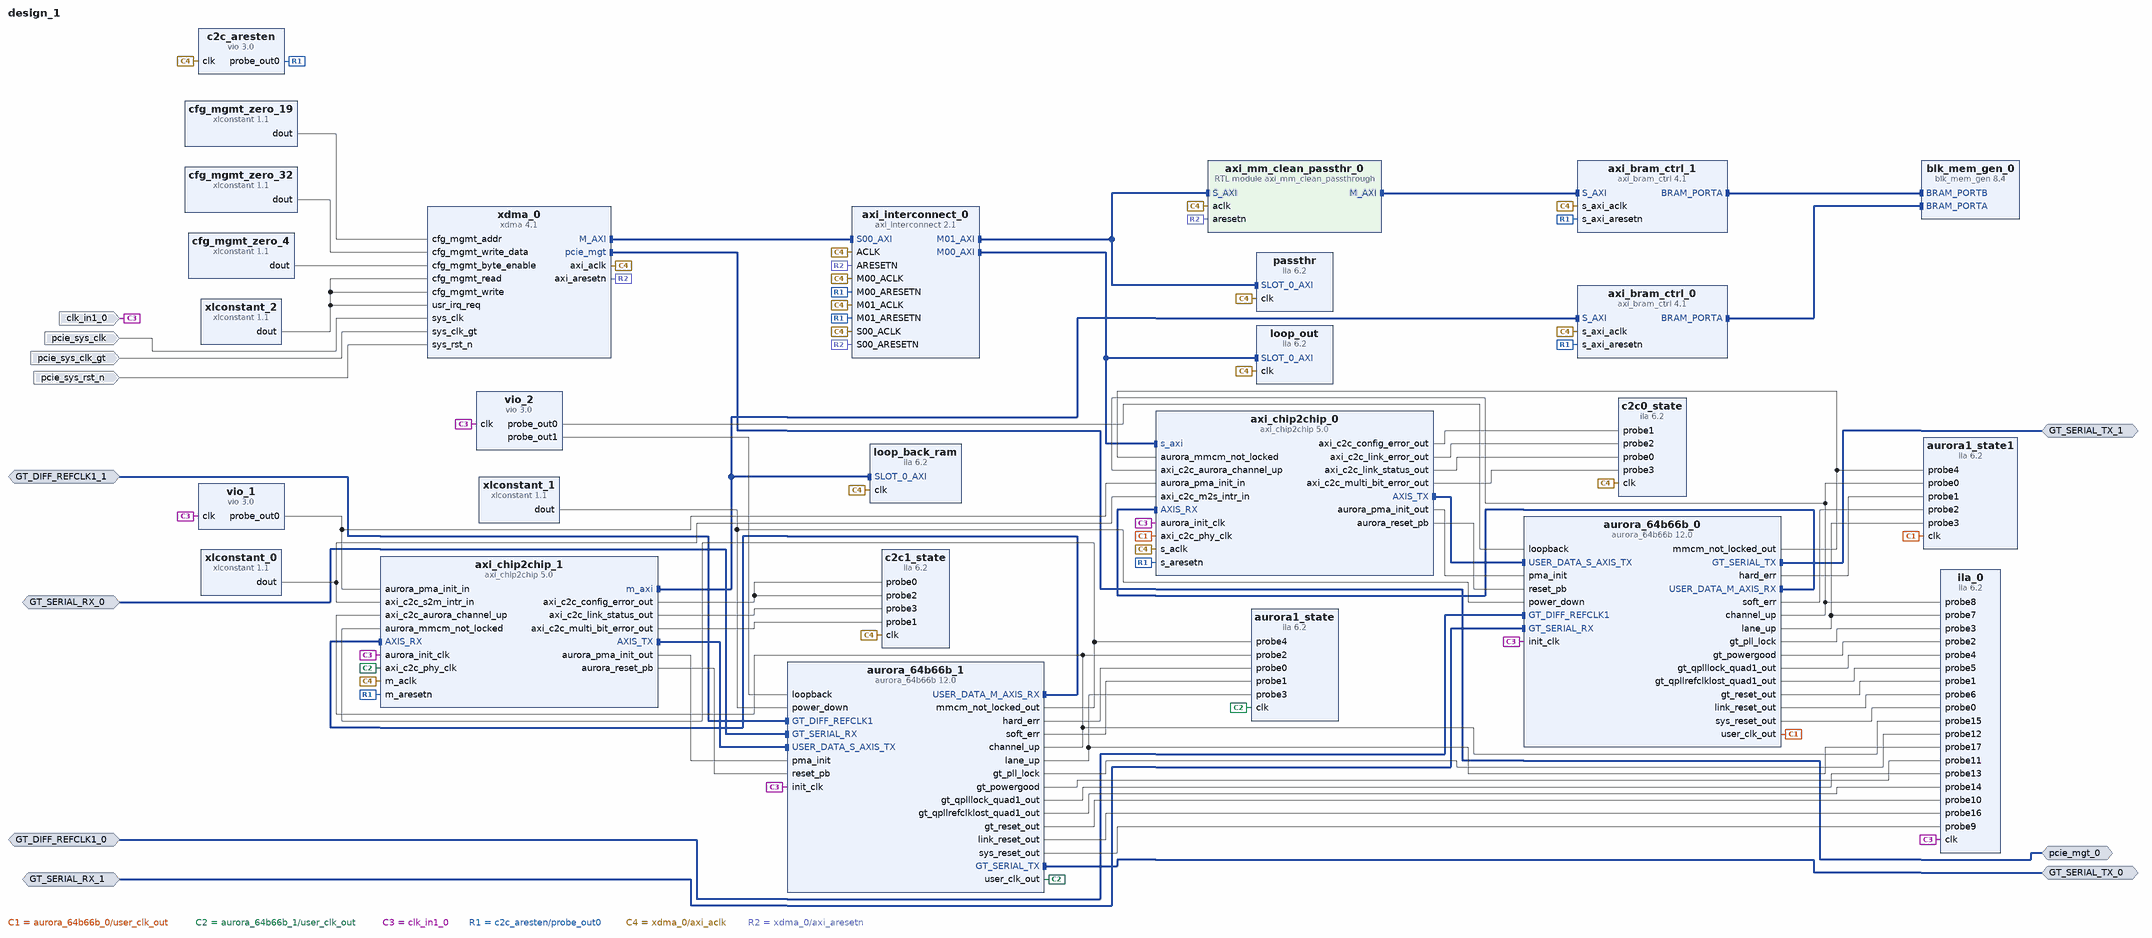
[diagram p0: block diagram of the top level]
# Vivado block design design_1, xcu280-fsvh2892-2L-e, Vivado 2021.2
create_bd_design design_1

create_bd_intf_port -mode Slave -vlnv xilinx.com:display_aurora:GT_Serial_Transceiver_Pins_RX_rtl:1.0 GT_SERIAL_RX_0
create_bd_intf_port -mode Master -vlnv xilinx.com:display_aurora:GT_Serial_Transceiver_Pins_TX_rtl:1.0 GT_SERIAL_TX_0
create_bd_intf_port -mode Slave -vlnv xilinx.com:display_aurora:GT_Serial_Transceiver_Pins_RX_rtl:1.0 GT_SERIAL_RX_1
create_bd_intf_port -mode Master -vlnv xilinx.com:display_aurora:GT_Serial_Transceiver_Pins_TX_rtl:1.0 GT_SERIAL_TX_1
create_bd_intf_port -mode Slave -vlnv xilinx.com:interface:diff_clock_rtl:1.0 GT_DIFF_REFCLK1_0
set_property -dict {CONFIG.FREQ_HZ 161132813} [get_bd_intf_ports GT_DIFF_REFCLK1_0]
create_bd_intf_port -mode Slave -vlnv xilinx.com:interface:diff_clock_rtl:1.0 GT_DIFF_REFCLK1_1
set_property -dict {CONFIG.FREQ_HZ 161132813} [get_bd_intf_ports GT_DIFF_REFCLK1_1]
create_bd_intf_port -mode Master -vlnv xilinx.com:interface:pcie_7x_mgt_rtl:1.0 pcie_mgt_0
create_bd_port -dir I -type clk clk_in1_0
create_bd_port -dir I -type clk pcie_sys_clk
set_property -dict {CONFIG.FREQ_HZ 100000000} [get_bd_ports pcie_sys_clk]
create_bd_port -dir I -type clk pcie_sys_clk_gt
set_property -dict {CONFIG.FREQ_HZ 100000000} [get_bd_ports pcie_sys_clk_gt]
create_bd_port -dir I -type rst pcie_sys_rst_n
set_property -dict {CONFIG.POLARITY ACTIVE_LOW} [get_bd_ports pcie_sys_rst_n]

create_bd_cell -type ip -vlnv xilinx.com:ip:aurora_64b66b:12.0 aurora_64b66b_0
set_property -dict [list \
  CONFIG.CHANNEL_ENABLE {X0Y40 X0Y41 X0Y42} \
  CONFIG.C_AURORA_LANES 3 \
  CONFIG.C_LINE_RATE 25.78125 \
  CONFIG.C_REFCLK_FREQUENCY 161.1328125 \
  CONFIG.C_REFCLK_SOURCE MGTREFCLK0_of_Quad_X0Y10 \
  CONFIG.C_START_LANE X0Y40 \
  CONFIG.C_START_QUAD Quad_X0Y10 \
  CONFIG.C_UCOLUMN_USED left \
  CONFIG.SupportLevel 1 \
  CONFIG.drp_mode Disabled \
  CONFIG.interface_mode Streaming \
] [get_bd_cells aurora_64b66b_0]
create_bd_cell -type ip -vlnv xilinx.com:ip:axi_chip2chip:5.0 axi_chip2chip_0
set_property -dict [list \
  CONFIG.C_AXI_ADDR_WIDTH 64 \
  CONFIG.C_AXI_DATA_WIDTH 128 \
  CONFIG.C_AXI_STB_WIDTH 16 \
  CONFIG.C_INTERFACE_MODE 0 \
  CONFIG.C_INTERFACE_TYPE 2 \
] [get_bd_cells axi_chip2chip_0]
create_bd_cell -type ip -vlnv xilinx.com:ip:axi_chip2chip:5.0 axi_chip2chip_1
set_property -dict [list \
  CONFIG.C_AXI_ADDR_WIDTH 64 \
  CONFIG.C_AXI_DATA_WIDTH 128 \
  CONFIG.C_AXI_STB_WIDTH 16 \
  CONFIG.C_INTERFACE_MODE 0 \
  CONFIG.C_INTERFACE_TYPE 2 \
  CONFIG.C_MASTER_FPGA 0 \
  CONFIG.C_M_AXI_ID_WIDTH 4 \
  CONFIG.C_M_AXI_WUSER_WIDTH 0 \
] [get_bd_cells axi_chip2chip_1]
create_bd_cell -type ip -vlnv xilinx.com:ip:aurora_64b66b:12.0 aurora_64b66b_1
set_property -dict [list \
  CONFIG.CHANNEL_ENABLE {X0Y44 X0Y45 X0Y46} \
  CONFIG.C_AURORA_LANES 3 \
  CONFIG.C_LINE_RATE 25.78125 \
  CONFIG.C_REFCLK_FREQUENCY 161.1328125 \
  CONFIG.C_REFCLK_SOURCE MGTREFCLK0_of_Quad_X0Y11 \
  CONFIG.C_START_LANE X0Y44 \
  CONFIG.C_START_QUAD Quad_X0Y11 \
  CONFIG.C_UCOLUMN_USED left \
  CONFIG.SupportLevel 1 \
  CONFIG.drp_mode Disabled \
  CONFIG.interface_mode Streaming \
] [get_bd_cells aurora_64b66b_1]
create_bd_cell -type ip -vlnv xilinx.com:ip:vio:3.0 c2c_aresten
set_property -dict [list \
  CONFIG.C_NUM_PROBE_IN 0 \
  CONFIG.C_NUM_PROBE_OUT 1 \
  CONFIG.C_PROBE_OUT0_INIT_VAL 0x1 \
  CONFIG.C_PROBE_OUT1_INIT_VAL 0x1 \
] [get_bd_cells c2c_aresten]
create_bd_cell -type ip -vlnv xilinx.com:ip:xlconstant:1.1 xlconstant_0
set_property -dict {CONFIG.CONST_VAL 0 CONFIG.CONST_WIDTH 4} [get_bd_cells xlconstant_0]
create_bd_cell -type ip -vlnv xilinx.com:ip:axi_bram_ctrl:4.1 axi_bram_ctrl_0
set_property -dict {CONFIG.DATA_WIDTH 128 CONFIG.READ_LATENCY 20 CONFIG.SINGLE_PORT_BRAM 1} [get_bd_cells axi_bram_ctrl_0]
create_bd_cell -type ip -vlnv xilinx.com:ip:blk_mem_gen:8.4 blk_mem_gen_0
set_property -dict [list \
  CONFIG.Memory_Type True_Dual_Port_RAM \
  CONFIG.PRIM_type_to_Implement URAM \
  CONFIG.Port_A_Write_Rate 50 \
  CONFIG.Port_B_Clock 100 \
  CONFIG.Port_B_Enable_Rate 100 \
  CONFIG.Port_B_Write_Rate 50 \
  CONFIG.READ_LATENCY_A 20 \
  CONFIG.READ_LATENCY_B 20 \
  CONFIG.Use_RSTB_Pin true \
] [get_bd_cells blk_mem_gen_0]
create_bd_cell -type ip -vlnv xilinx.com:ip:ila:6.2 loop_out
set_property -dict {CONFIG.C_DATA_DEPTH 2048} [get_bd_cells loop_out]
create_bd_cell -type ip -vlnv xilinx.com:ip:ila:6.2 loop_back_ram
set_property -dict {CONFIG.C_DATA_DEPTH 1024} [get_bd_cells loop_back_ram]
create_bd_cell -type ip -vlnv xilinx.com:ip:xlconstant:1.1 xlconstant_1
set_property -dict {CONFIG.CONST_VAL 0} [get_bd_cells xlconstant_1]
create_bd_cell -type ip -vlnv xilinx.com:ip:ila:6.2 c2c1_state
set_property -dict [list \
  CONFIG.C_ENABLE_ILA_AXI_MON false \
  CONFIG.C_MONITOR_TYPE Native \
  CONFIG.C_NUM_OF_PROBES 4 \
] [get_bd_cells c2c1_state]
create_bd_cell -type ip -vlnv xilinx.com:ip:ila:6.2 c2c0_state
set_property -dict [list \
  CONFIG.C_ENABLE_ILA_AXI_MON false \
  CONFIG.C_MONITOR_TYPE Native \
  CONFIG.C_NUM_OF_PROBES 4 \
] [get_bd_cells c2c0_state]
create_bd_cell -type ip -vlnv xilinx.com:ip:ila:6.2 aurora1_state
set_property -dict [list \
  CONFIG.C_ENABLE_ILA_AXI_MON false \
  CONFIG.C_MONITOR_TYPE Native \
  CONFIG.C_NUM_OF_PROBES 5 \
] [get_bd_cells aurora1_state]
create_bd_cell -type ip -vlnv xilinx.com:ip:ila:6.2 aurora1_state1
set_property -dict [list \
  CONFIG.C_ENABLE_ILA_AXI_MON false \
  CONFIG.C_MONITOR_TYPE Native \
  CONFIG.C_NUM_OF_PROBES 5 \
] [get_bd_cells aurora1_state1]
create_bd_cell -type ip -vlnv xilinx.com:ip:vio:3.0 vio_1
set_property -dict {CONFIG.C_NUM_PROBE_IN 0 CONFIG.C_PROBE_OUT0_INIT_VAL 0x1} [get_bd_cells vio_1]
create_bd_cell -type ip -vlnv xilinx.com:ip:ila:6.2 ila_0
set_property -dict {CONFIG.C_ENABLE_ILA_AXI_MON false CONFIG.C_MONITOR_TYPE Native CONFIG.C_NUM_OF_PROBES 18} [get_bd_cells ila_0]
create_bd_cell -type ip -vlnv xilinx.com:ip:vio:3.0 vio_2
set_property -dict [list \
  CONFIG.C_NUM_PROBE_IN 0 \
  CONFIG.C_NUM_PROBE_OUT 2 \
  CONFIG.C_PROBE_OUT0_WIDTH 3 \
  CONFIG.C_PROBE_OUT1_WIDTH 3 \
] [get_bd_cells vio_2]
create_bd_cell -type ip -vlnv xilinx.com:ip:xdma:4.1 xdma_0
set_property -dict [list \
  CONFIG.PCIE_BOARD_INTERFACE pci_express_x4 \
  CONFIG.PF0_DEVICE_ID_mqdma 9034 \
  CONFIG.PF0_SRIOV_VF_DEVICE_ID A034 \
  CONFIG.PF2_DEVICE_ID_mqdma 9234 \
  CONFIG.PF3_DEVICE_ID_mqdma 9334 \
  CONFIG.SYS_RST_N_BOARD_INTERFACE pcie_perstn \
  CONFIG.axi_data_width 128_bit \
  CONFIG.axisten_freq 250 \
  CONFIG.bridge_burst false \
  CONFIG.en_bridge_slv true \
  CONFIG.functional_mode DMA \
  CONFIG.mode_selection Advanced \
  CONFIG.pf0_bar0_64bit true \
  CONFIG.pf0_bar0_prefetchable true \
  CONFIG.pf0_device_id 9034 \
  CONFIG.pl_link_cap_max_link_speed 8.0_GT/s \
  CONFIG.plltype QPLL1 \
  CONFIG.xdma_axilite_slave false \
  CONFIG.xdma_pcie_64bit_en true \
  CONFIG.xdma_pcie_prefetchable true \
] [get_bd_cells xdma_0]
create_bd_cell -type ip -vlnv xilinx.com:ip:xlconstant:1.1 xlconstant_2
set_property -dict {CONFIG.CONST_VAL 0} [get_bd_cells xlconstant_2]
create_bd_cell -type ip -vlnv xilinx.com:ip:axi_bram_ctrl:4.1 axi_bram_ctrl_1
set_property -dict {CONFIG.DATA_WIDTH 128 CONFIG.READ_LATENCY 20 CONFIG.SINGLE_PORT_BRAM 1} [get_bd_cells axi_bram_ctrl_1]
create_bd_cell -type ip -vlnv xilinx.com:ip:xlconstant:1.1 cfg_mgmt_zero_19
set_property -dict {CONFIG.CONST_VAL 0 CONFIG.CONST_WIDTH 19} [get_bd_cells cfg_mgmt_zero_19]
create_bd_cell -type ip -vlnv xilinx.com:ip:xlconstant:1.1 cfg_mgmt_zero_4
set_property -dict {CONFIG.CONST_VAL 0 CONFIG.CONST_WIDTH 4} [get_bd_cells cfg_mgmt_zero_4]
create_bd_cell -type ip -vlnv xilinx.com:ip:xlconstant:1.1 cfg_mgmt_zero_32
set_property -dict {CONFIG.CONST_VAL 0 CONFIG.CONST_WIDTH 32} [get_bd_cells cfg_mgmt_zero_32]
create_bd_cell -type ip -vlnv xilinx.com:ip:ila:6.2 passthr
set_property -dict {CONFIG.C_DATA_DEPTH 1024} [get_bd_cells passthr]
create_bd_cell -type ip -vlnv xilinx.com:ip:axi_interconnect:2.1 axi_interconnect_0
set_property -dict [list \
  CONFIG.ENABLE_ADVANCED_OPTIONS 1 \
  CONFIG.M00_HAS_DATA_FIFO 1 \
  CONFIG.M00_HAS_REGSLICE 3 \
  CONFIG.M00_SECURE 0 \
  CONFIG.M01_HAS_DATA_FIFO 1 \
  CONFIG.M01_HAS_REGSLICE 3 \
  CONFIG.S00_HAS_DATA_FIFO 2 \
  CONFIG.S00_HAS_REGSLICE 3 \
  CONFIG.STRATEGY 2 \
] [get_bd_cells axi_interconnect_0]
create_bd_cell -type module -reference axi_mm_clean_passthrough axi_mm_clean_passthr_0

# ---- connections ----

connect_bd_intf_net -intf_net GT_DIFF_REFCLK1_0_1 [get_bd_intf_ports GT_DIFF_REFCLK1_0] [get_bd_intf_pins aurora_64b66b_0/GT_DIFF_REFCLK1]
connect_bd_intf_net -intf_net GT_DIFF_REFCLK1_1_1 [get_bd_intf_ports GT_DIFF_REFCLK1_1] [get_bd_intf_pins aurora_64b66b_1/GT_DIFF_REFCLK1]
connect_bd_intf_net -intf_net GT_SERIAL_RX_0_1 [get_bd_intf_ports GT_SERIAL_RX_0] [get_bd_intf_pins aurora_64b66b_1/GT_SERIAL_RX]
connect_bd_intf_net -intf_net GT_SERIAL_RX_1_1 [get_bd_intf_ports GT_SERIAL_RX_1] [get_bd_intf_pins aurora_64b66b_0/GT_SERIAL_RX]
connect_bd_intf_net [get_bd_intf_pins axi_interconnect_0/S00_AXI] [get_bd_intf_pins xdma_0/M_AXI]
connect_bd_intf_net [get_bd_intf_ports GT_SERIAL_TX_1] [get_bd_intf_pins aurora_64b66b_0/GT_SERIAL_TX]
connect_bd_intf_net [get_bd_intf_pins aurora_64b66b_0/USER_DATA_M_AXIS_RX] [get_bd_intf_pins axi_chip2chip_0/AXIS_RX]
connect_bd_intf_net [get_bd_intf_ports GT_SERIAL_TX_0] [get_bd_intf_pins aurora_64b66b_1/GT_SERIAL_TX]
connect_bd_intf_net [get_bd_intf_pins aurora_64b66b_1/USER_DATA_M_AXIS_RX] [get_bd_intf_pins axi_chip2chip_1/AXIS_RX]
connect_bd_intf_net [get_bd_intf_pins blk_mem_gen_0/BRAM_PORTA] [get_bd_intf_pins axi_bram_ctrl_0/BRAM_PORTA]
connect_bd_intf_net [get_bd_intf_pins axi_bram_ctrl_1/BRAM_PORTA] [get_bd_intf_pins blk_mem_gen_0/BRAM_PORTB]
connect_bd_intf_net [get_bd_intf_pins axi_chip2chip_0/AXIS_TX] [get_bd_intf_pins aurora_64b66b_0/USER_DATA_S_AXIS_TX]
connect_bd_intf_net [get_bd_intf_pins axi_chip2chip_1/AXIS_TX] [get_bd_intf_pins aurora_64b66b_1/USER_DATA_S_AXIS_TX]
connect_bd_intf_net [get_bd_intf_pins axi_bram_ctrl_0/S_AXI] [get_bd_intf_pins axi_chip2chip_1/m_axi]
connect_bd_intf_net [get_bd_intf_pins axi_bram_ctrl_0/S_AXI] [get_bd_intf_pins loop_back_ram/SLOT_0_AXI]
connect_bd_intf_net [get_bd_intf_pins axi_bram_ctrl_1/S_AXI] [get_bd_intf_pins axi_mm_clean_passthr_0/M_AXI]
connect_bd_intf_net -intf_net smartconnect_0_M00_AXI [get_bd_intf_pins axi_interconnect_0/M00_AXI] [get_bd_intf_pins axi_chip2chip_0/s_axi]
connect_bd_intf_net [get_bd_intf_pins axi_interconnect_0/M00_AXI] [get_bd_intf_pins loop_out/SLOT_0_AXI]
connect_bd_intf_net -intf_net smartconnect_0_M01_AXI [get_bd_intf_pins axi_mm_clean_passthr_0/S_AXI] [get_bd_intf_pins axi_interconnect_0/M01_AXI]
connect_bd_intf_net [get_bd_intf_pins axi_mm_clean_passthr_0/S_AXI] [get_bd_intf_pins passthr/SLOT_0_AXI]
connect_bd_intf_net [get_bd_intf_ports pcie_mgt_0] [get_bd_intf_pins xdma_0/pcie_mgt]
connect_bd_net [get_bd_pins aurora_64b66b_0/channel_up] \
  [get_bd_pins aurora1_state1/probe0] [get_bd_pins axi_chip2chip_0/axi_c2c_aurora_channel_up] [get_bd_pins ila_0/probe8]
connect_bd_net [get_bd_pins aurora_64b66b_0/gt_pll_lock] [get_bd_pins ila_0/probe3]
connect_bd_net [get_bd_pins aurora_64b66b_0/gt_powergood] [get_bd_pins ila_0/probe2]
connect_bd_net [get_bd_pins aurora_64b66b_0/gt_qplllock_quad1_out] [get_bd_pins ila_0/probe4]
connect_bd_net [get_bd_pins aurora_64b66b_0/gt_qpllrefclklost_quad1_out] [get_bd_pins ila_0/probe5]
connect_bd_net [get_bd_pins aurora_64b66b_0/gt_reset_out] [get_bd_pins ila_0/probe1]
connect_bd_net [get_bd_pins aurora_64b66b_0/hard_err] [get_bd_pins aurora1_state1/probe1]
connect_bd_net [get_bd_pins aurora_64b66b_0/lane_up] [get_bd_pins aurora1_state1/probe3] [get_bd_pins ila_0/probe7]
connect_bd_net [get_bd_pins aurora_64b66b_0/link_reset_out] [get_bd_pins ila_0/probe6]
connect_bd_net [get_bd_pins aurora_64b66b_0/mmcm_not_locked_out] \
  [get_bd_pins axi_chip2chip_0/aurora_mmcm_not_locked] [get_bd_pins aurora1_state1/probe4]
connect_bd_net [get_bd_pins aurora_64b66b_0/soft_err] [get_bd_pins aurora1_state1/probe2]
connect_bd_net [get_bd_pins aurora_64b66b_0/sys_reset_out] [get_bd_pins ila_0/probe0]
connect_bd_net [get_bd_pins aurora_64b66b_0/user_clk_out] [get_bd_pins axi_chip2chip_0/axi_c2c_phy_clk] [get_bd_pins aurora1_state1/clk]
connect_bd_net [get_bd_pins aurora_64b66b_1/channel_up] \
  [get_bd_pins axi_chip2chip_1/axi_c2c_aurora_channel_up] [get_bd_pins aurora1_state/probe2] [get_bd_pins ila_0/probe15]
connect_bd_net [get_bd_pins aurora_64b66b_1/gt_pll_lock] [get_bd_pins ila_0/probe12]
connect_bd_net [get_bd_pins aurora_64b66b_1/gt_powergood] [get_bd_pins ila_0/probe11]
connect_bd_net [get_bd_pins aurora_64b66b_1/gt_qplllock_quad1_out] [get_bd_pins ila_0/probe13]
connect_bd_net [get_bd_pins aurora_64b66b_1/gt_qpllrefclklost_quad1_out] [get_bd_pins ila_0/probe14]
connect_bd_net [get_bd_pins aurora_64b66b_1/gt_reset_out] [get_bd_pins ila_0/probe10]
connect_bd_net [get_bd_pins aurora_64b66b_1/hard_err] [get_bd_pins aurora1_state/probe0]
connect_bd_net [get_bd_pins aurora_64b66b_1/lane_up] [get_bd_pins aurora1_state/probe3] [get_bd_pins ila_0/probe17]
connect_bd_net [get_bd_pins aurora_64b66b_1/link_reset_out] [get_bd_pins ila_0/probe16]
connect_bd_net [get_bd_pins aurora_64b66b_1/mmcm_not_locked_out] \
  [get_bd_pins axi_chip2chip_1/aurora_mmcm_not_locked] [get_bd_pins aurora1_state/probe4]
connect_bd_net [get_bd_pins aurora_64b66b_1/soft_err] [get_bd_pins aurora1_state/probe1]
connect_bd_net [get_bd_pins aurora_64b66b_1/sys_reset_out] [get_bd_pins ila_0/probe9]
connect_bd_net [get_bd_pins aurora_64b66b_1/user_clk_out] [get_bd_pins axi_chip2chip_1/axi_c2c_phy_clk] [get_bd_pins aurora1_state/clk]
connect_bd_net [get_bd_pins axi_chip2chip_0/aurora_pma_init_out] [get_bd_pins aurora_64b66b_0/pma_init]
connect_bd_net [get_bd_pins axi_chip2chip_0/aurora_reset_pb] [get_bd_pins aurora_64b66b_0/reset_pb]
connect_bd_net [get_bd_pins axi_chip2chip_0/axi_c2c_config_error_out] [get_bd_pins c2c0_state/probe1]
connect_bd_net [get_bd_pins axi_chip2chip_0/axi_c2c_link_error_out] [get_bd_pins c2c0_state/probe2]
connect_bd_net [get_bd_pins axi_chip2chip_0/axi_c2c_link_status_out] [get_bd_pins c2c0_state/probe0]
connect_bd_net [get_bd_pins axi_chip2chip_0/axi_c2c_multi_bit_error_out] [get_bd_pins c2c0_state/probe3]
connect_bd_net [get_bd_pins axi_chip2chip_1/aurora_pma_init_out] [get_bd_pins aurora_64b66b_1/pma_init]
connect_bd_net [get_bd_pins axi_chip2chip_1/aurora_reset_pb] [get_bd_pins aurora_64b66b_1/reset_pb]
connect_bd_net [get_bd_pins axi_chip2chip_1/axi_c2c_config_error_out] [get_bd_pins c2c1_state/probe2] [get_bd_pins c2c1_state/probe0]
connect_bd_net [get_bd_pins axi_chip2chip_1/axi_c2c_link_status_out] [get_bd_pins c2c1_state/probe3]
connect_bd_net [get_bd_pins axi_chip2chip_1/axi_c2c_multi_bit_error_out] [get_bd_pins c2c1_state/probe1]
connect_bd_net [get_bd_pins cfg_mgmt_zero_19/dout] [get_bd_pins xdma_0/cfg_mgmt_addr]
connect_bd_net [get_bd_pins cfg_mgmt_zero_32/dout] [get_bd_pins xdma_0/cfg_mgmt_write_data]
connect_bd_net [get_bd_pins cfg_mgmt_zero_4/dout] [get_bd_pins xdma_0/cfg_mgmt_byte_enable]
connect_bd_net -net clk_100M [get_bd_ports clk_in1_0] \
  [get_bd_pins axi_chip2chip_0/aurora_init_clk] [get_bd_pins axi_chip2chip_1/aurora_init_clk] \
  [get_bd_pins aurora_64b66b_0/init_clk] [get_bd_pins aurora_64b66b_1/init_clk] [get_bd_pins vio_1/clk] \
  [get_bd_pins ila_0/clk] [get_bd_pins vio_2/clk]
connect_bd_net -net master_restn [get_bd_pins c2c_aresten/probe_out0] \
  [get_bd_pins axi_chip2chip_0/s_aresetn] [get_bd_pins axi_chip2chip_1/m_aresetn] [get_bd_pins axi_bram_ctrl_0/s_axi_aresetn] \
  [get_bd_pins axi_bram_ctrl_1/s_axi_aresetn] [get_bd_pins axi_interconnect_0/M00_ARESETN] \
  [get_bd_pins axi_interconnect_0/M01_ARESETN]
connect_bd_net [get_bd_ports pcie_sys_clk] [get_bd_pins xdma_0/sys_clk]
connect_bd_net [get_bd_ports pcie_sys_clk_gt] [get_bd_pins xdma_0/sys_clk_gt]
connect_bd_net [get_bd_ports pcie_sys_rst_n] [get_bd_pins xdma_0/sys_rst_n]
connect_bd_net -net pma_init [get_bd_pins vio_1/probe_out0] \
  [get_bd_pins axi_chip2chip_0/aurora_pma_init_in] [get_bd_pins axi_chip2chip_1/aurora_pma_init_in]
connect_bd_net [get_bd_pins vio_2/probe_out0] [get_bd_pins aurora_64b66b_0/loopback]
connect_bd_net [get_bd_pins vio_2/probe_out1] [get_bd_pins aurora_64b66b_1/loopback]
connect_bd_net [get_bd_pins xdma_0/axi_aclk] \
  [get_bd_pins c2c_aresten/clk] [get_bd_pins axi_chip2chip_1/m_aclk] [get_bd_pins axi_chip2chip_0/s_aclk] \
  [get_bd_pins loop_out/clk] [get_bd_pins loop_back_ram/clk] [get_bd_pins axi_bram_ctrl_1/s_axi_aclk] \
  [get_bd_pins axi_bram_ctrl_0/s_axi_aclk] [get_bd_pins c2c0_state/clk] [get_bd_pins c2c1_state/clk] \
  [get_bd_pins passthr/clk] [get_bd_pins axi_interconnect_0/ACLK] [get_bd_pins axi_interconnect_0/S00_ACLK] \
  [get_bd_pins axi_interconnect_0/M00_ACLK] [get_bd_pins axi_interconnect_0/M01_ACLK] \
  [get_bd_pins axi_mm_clean_passthr_0/aclk]
connect_bd_net [get_bd_pins xdma_0/axi_aresetn] \
  [get_bd_pins axi_interconnect_0/S00_ARESETN] [get_bd_pins axi_interconnect_0/ARESETN] \
  [get_bd_pins axi_mm_clean_passthr_0/aresetn]
connect_bd_net [get_bd_pins xlconstant_0/dout] [get_bd_pins axi_chip2chip_1/axi_c2c_s2m_intr_in] [get_bd_pins axi_chip2chip_0/axi_c2c_m2s_intr_in]
connect_bd_net [get_bd_pins xlconstant_1/dout] [get_bd_pins aurora_64b66b_1/power_down] [get_bd_pins aurora_64b66b_0/power_down]
connect_bd_net [get_bd_pins xlconstant_2/dout] [get_bd_pins xdma_0/cfg_mgmt_read] [get_bd_pins xdma_0/cfg_mgmt_write] [get_bd_pins xdma_0/usr_irq_req]

# ---- address map ----
assign_bd_address -offset 0x0000000000000000 -range 4M -target_address_space [get_bd_addr_spaces axi_chip2chip_1/MAXI] [get_bd_addr_segs axi_bram_ctrl_0/S_AXI/Mem0]
assign_bd_address -offset 0x0000000000000000 -range 4M -target_address_space [get_bd_addr_spaces axi_mm_clean_passthr_0/M_AXI] [get_bd_addr_segs axi_bram_ctrl_1/S_AXI/Mem0]
assign_bd_address -offset 0x0000000000000000 -range 4T -target_address_space [get_bd_addr_spaces xdma_0/M_AXI] [get_bd_addr_segs axi_chip2chip_0/s_axi/Mem0]
assign_bd_address -offset 0x0000100000000000 -range 4T -target_address_space [get_bd_addr_spaces xdma_0/M_AXI] [get_bd_addr_segs axi_mm_clean_passthr_0/S_AXI/reg0]

validate_bd_design
save_bd_design
